# Altium schematic sheet Mosione.SchDoc
size A4; Organization: Altium Limited; Address1: L3, 12a Rodborough Rd; Address2: Frenchs Forest; Address3: NSW; Address4: Australia 2086
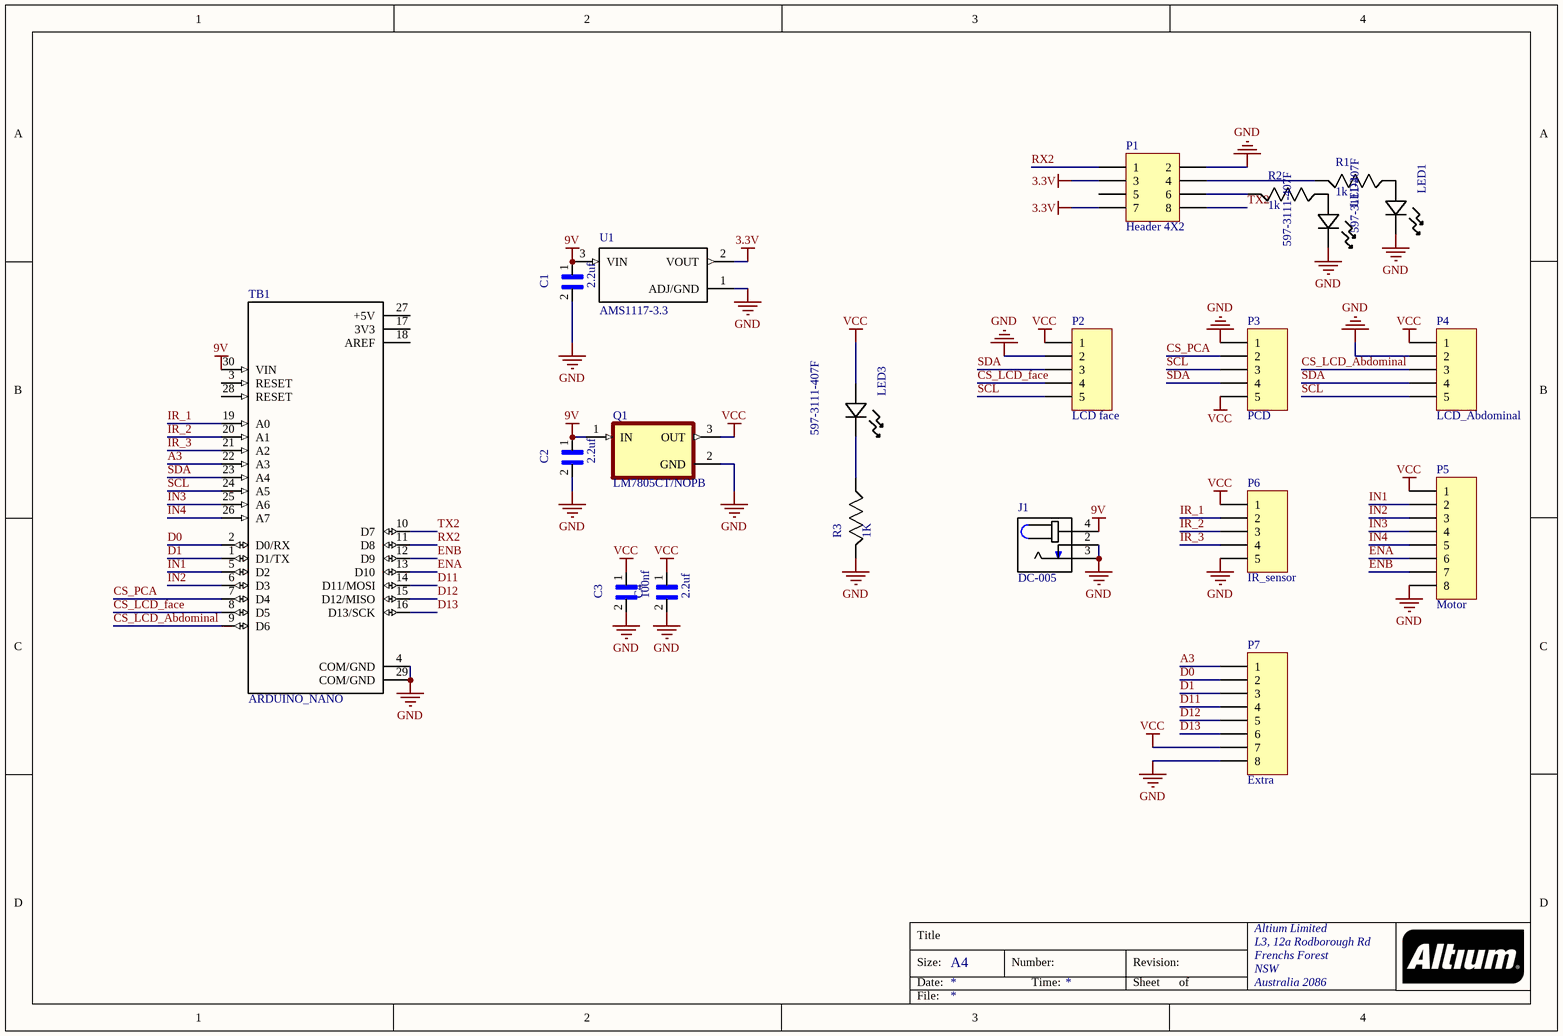
[diagram p0: Mosione.SchDoc]

## Parts
C1  2.2uf  [*CAPC320160X94]
C2  2.2uf  [*CAPC320160X94]
C3  100nf  [*CAPC320160X94]
C4  2.2uf  [*CAPC320160X94]
J1  DC-005  [*NINIGI_DC-005]
LED1  597-3111-407F  [*LED_597-3111-407F]
LED2  597-3111-407F  [*LED_597-3111-407F]
LED3  597-3111-407F  [*LED_597-3111-407F]
P1  Header 4X2  [HDR2X4]
P2  LCD face  [HDR1X5]
P3  PCD  [HDR1X5]
P4  LCD_Abdominal  [HDR1X5]
P5  Motor  [HDR1X8]
P6  IR_sensor  [HDR1X5]
P7  Extra  [HDR1X8]
Q1  LM7805CT/NOPB  [TO254P1054X470X2600-3]
R1  1k  [RESC3216X06N]
R2  1k  [RESC3216X06N]
R3  1K  [RESC3216X06N]
TB1  ARDUINO_NANO  [*SHIELD_ARDUINO_NANO]
U1  AMS1117-3.3  [*SOT229P700X180-4N]

## Nets
3.3V: P1.3 P1.7 U1.2(VOUT)
9V: C1.1 C2.1 J1.4 Q1.1(IN) TB1.30(VIN) U1.3(VIN)
GND: C1.2 C2.2 C3.2 C4.2 J1.2 J1.3 LED1.1 LED2.1 P1.2 P2.2 P3.1 P4.2 P5.8 P6.5 P7.8 Q1.2(GND) R3.1 TB1.4(COM/GND) TB1.29(COM/GND) U1.1(ADJ/GND)
VCC: C3.1 C4.1 LED3.2 P2.1 P3.5 P4.1 P5.1 P6.1 P7.7 Q1.3(OUT)
A3: P7.1 TB1.22(A3)
CS_LCD_Abdominal: P4.3 TB1.9(D6)
CS_LCD_face: P2.4 TB1.8(D5)
CS_PCA: P3.2 TB1.7(D4)
D0: P7.2 TB1.2(D0/RX)
D1: P7.3 TB1.1(D1/TX)
D11: P7.4 TB1.14(D11/MOSI)
D12: P7.5 TB1.15(D12/MISO)
D13: P7.6 TB1.16(D13/SCK)
ENA: P5.6 TB1.13(D10)
ENB: P5.7 TB1.12(D9)
IN1: P5.2 TB1.5(D2)
IN2: P5.3 TB1.6(D3)
IN3: P5.4 TB1.25(A6)
IN4: P5.5 TB1.26(A7)
IR_1: P6.2 TB1.19(A0)
IR_2: P6.3 TB1.20(A1)
IR_3: P6.4 TB1.21(A2)
RX2: P1.1 TB1.11(D8)
SCL: P2.5 P3.3 P4.5 TB1.24(A5)
SDA: P2.3 P3.4 P4.4 TB1.23(A4)
TX2: P1.8 TB1.10(D7)
NetLED1_2: LED1.2 R1.2
NetLED2_2: LED2.2 R2.2
NetLED3_1: LED3.1 R3.2
NetP1_4: P1.4 R1.1
NetP1_6: P1.6 R2.1

Not connected (* = marked no-connect by the designer): P1 5; TB1 3(RESET) 17(3V3) 18(AREF) 27(+5V) 28(RESET)

## Notes on the sheet
- Title
- Size:
- Date:
- A4
- Number:
- Time:
- Revision:
- Sheet
- of
- File:

## Library data of the parts
C1-C4 = 12065C824KAZ2A: Cap Ceramic 0.82uF 50V X7R 10% SMD 1206 125Ã‚Â°C Paper T/R; MF: AVX; Package: 1206 AVX; SnapEDA_Link: https://www.snapeda.com/parts/12065C824KAZ2A/AVX/view-part/?ref=snap; MP: 12065C824KAZ2A; Price: None; Availability: Unavailable; Value: *
J1 = DC-005: MF: Littelfuse Inc.; Package: 0603 Ninigi; MP: DC-005; SnapEDA_Link: https://www.snapeda.com/parts/DC-005/Littelfuse%20Inc./view-part/?ref=snap; Availability: Unavailable; Price: None; Value: *
LED1-LED3 = 597-3111-407F: LED RED CLEAR 1206 SMD; MP: 5973111407F; MF: Dialight; Package: 1206 Dialight; SnapEDA_Link: https://www.snapeda.com/parts/5973111407F/Dialight/view-part/?ref=snap; Availability: Unavailable; Price: None; Value: *
P1 = Header 4X2: Header, 4-Pin, Dual row; LatestRevisionDate: 17-Jul-2002; LatestRevisionNote: Re-released for DXP Platform.; Publisher: Altium Limited
P2-P4 P6 = Header 5: Header, 5-Pin; LatestRevisionDate: 17-Jul-2002; LatestRevisionNote: Re-released for DXP Platform.; Publisher: Altium Limited
P5 P7 = Header 8: Header, 8-Pin; LatestRevisionDate: 17-Jul-2002; LatestRevisionNote: Re-released for DXP Platform.; Publisher: Altium Limited
Q1 = LM7805CT/NOPB: Linear Voltage Regulator IC 1 Output 1A TO-220-3; MF: ON Semiconductor; MP: LM7805CT; SnapEDA_Link: https://www.snapeda.com/parts/LM7805CT/ON%20Semiconductor/view-part/546231/?ref=snap; Price: None; Package: TO-220 ON Semiconductor; Value: *; Availability: Unavailable
R1-R3 = RC1206FR-0724R3L: RC Series 1206 0.25 W 24.3 Ohms 1% Â±100 ppm/Â°C SMT Thick Film Chip Resistor; MF: Yageo; MP: RC1206FR-0724R3L; Package: 1206 Yageo; Price: None; Availability: Unavailable; SnapEDA_Link: https://www.snapeda.com/parts/RC1206FR-0724R3L/Yageo/view-part/?ref=snap; Value: *
TB1 = ARDUINO_NANO: ATmega4809 Arduino Nano Every with Headers AVRÂ® AVR MCU 8-Bit Embedded Evaluation Board; MP: ARDUINO NANO; Package: None; SnapEDA_Link: https://www.snapeda.com/parts/ARDUINO%20NANO/Arduino/view-part/1128261/?ref=snap; Price: None; MF: Arduino; Availability: Unavailable; Value: *
U1 = AMS1117-3.3: MF: AMD; SnapEDA_Link: https://www.snapeda.com/parts/AMS1117-3.3/AMD/view-part/?ref=snap; Availability: Unavailable; Package: None; Price: None; MP: AMS1117-3.3; Value: *